# Altium project B2B_Charger.PrjPcb (part 3 of 3)
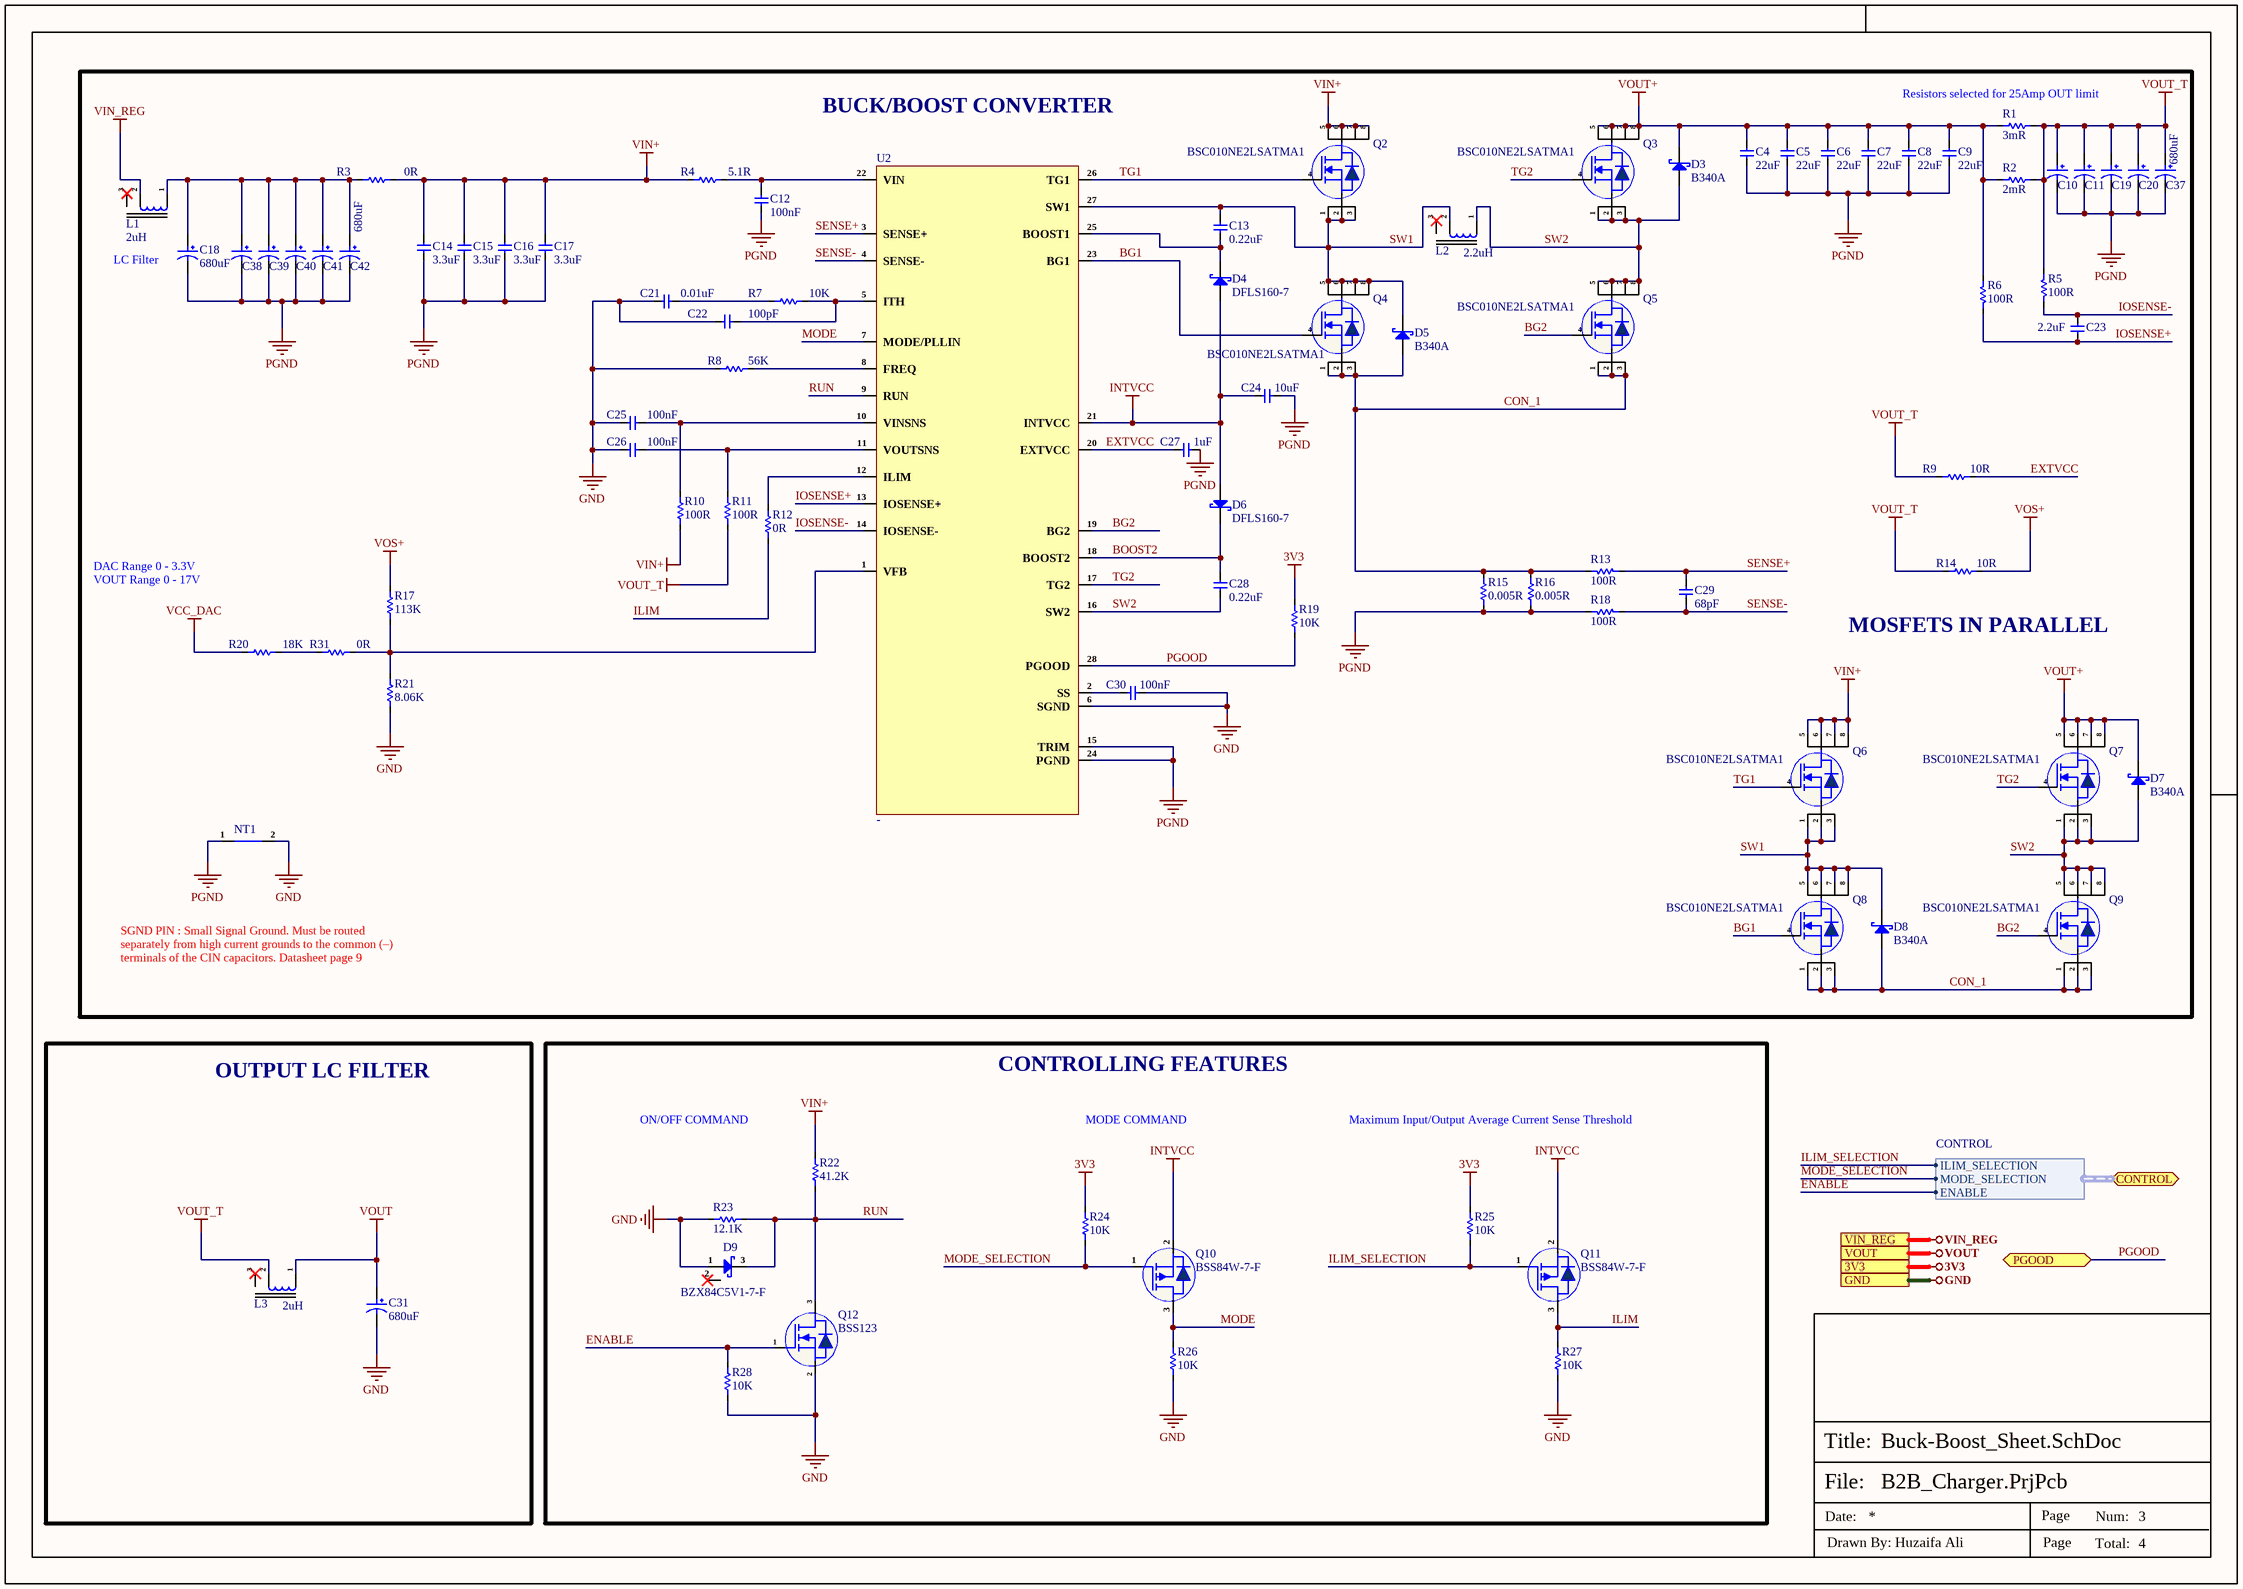
[diagram p5: Buck-Boost_Sheet.SchDoc]

## Sheet Buck-Boost_Sheet.SchDoc (continued)

### Library data of the parts (continued)
R23 = RT0603CRD0712K1L: RES SMD 12.1K OHM 1/10W 0603; Manufacturer: Yageo; Resistance: 12.1kR; Tolerance: 0.25%; Temperature Coefficient: 25ppm/°C; Power Rating: 100mW; Voltage Rating: 75V; Voltage Rating (DC): 50V; Supplier 1: Digi-Key; Manufacturer Part Number: RT0603CRD0712K1L; RoHS: Yes; Category: Chip SMD Resistors; Pricing 1: 5000=0.06299 (USD); Case/Package: 0603; Contact Plating: Tin,Matte; Case Code (Metric): 1608; Case Code (Imperial): 0603; Min Operating Temperature: -55°C; Max Operating Temperature: 125°C; Resistor Type: Thin Film; Package Quantity: 5000; Packaging: Tape and Reel; Number of Terminations: 2; Termination: SMD/SMT; Max Power Dissipation: 100mW; Series: RT; Length: 0.063inch; Width: 0.031inch; Height: 0.022inch; Radiation Hardening: No; Lead Free: Lead Free; RoHS Compliant: Yes; ComponentLink1URL: https://datasheet.ciiva.com/2590/pyu-rt-1-to-0-05-rohs-l-5-2590806.pdf?src-supplier=Digi-Key; ComponentLink1Description: https://datasheet.ciiva.com/2590/pyu-rt-1-to-0-05-rohs-l-5-2590806.pdf?src-supplier=Digi-Key; ComponentLink2URL: https://datasheet.ciiva.com/8891/pyu-rt-1-to-0-05-rohs-l-4-8891049.pdf?src-supplier=Avnet; ComponentLink2Description: https://datasheet.ciiva.com/8891/pyu-rt-1-to-0-05-rohs-l-4-8891049.pdf?src-supplier=Avnet; ComponentLink3URL: https://datasheet.ciiva.com/12721/pyu-rt-1-to-0-05-rohs-l-4-12721018.pdf?src-supplier=Mouser; ComponentLink3Description: https://datasheet.ciiva.com/12721/pyu-rt-1-to-0-05-rohs-l-4-12721018.pdf?src-supplier=Mouser; Supplier Part Number 1: RT0603CRD0712K1L-ND; LCSC Part Number: C705893
R31 = RC0805FR-070RL: RES 0 OHM JUMPER 1/8W 0805; Manufacturer: Yageo; Resistance: 0mR; Tolerance: 1%; Power Rating: 125mW; Item Type: Resistor; Supplier 1: Avnet; Manufacturer Part Number: RC0805FR-070RL; RoHS: Yes; Category: Chip SMD Resistors; Stock 1: 85000; Pricing 1: 5000=0.00281, 10000=0.00277, 20000=0.00269 (USD); Case/Package: 0805; Contact Plating: Tin,Matte; Case Code (Imperial): 0805; Case Code (Metric): 2012; Size Code: 0805; Min Operating Temperature: -55°C; Max Operating Temperature: 155°C; Resistor Type: Thick Film; Packaging: Tape and Reel; Features: Moisture Resistant; Series: RC; Max Power Dissipation: 125mW; Number of Terminations: 2; Construction: Rectangular; Length: 2mm; Depth: 1.25mm; Radiation Hardening: No; Military Standard: Not; Lead Free: Lead Free; RoHS Compliant: Yes; ComponentLink1URL: https://datasheet.ciiva.com/15189/getdatasheetpartid-348154-15189885.pdf?src-supplier=Verical; ComponentLink1Description: https://datasheet.ciiva.com/15189/getdatasheetpartid-348154-15189885.pdf?src-supplier=Verical; ComponentLink2URL: https://datasheet.ciiva.com/17042/rc0805-17042698.pdf?src-supplier=Future+Electronics; ComponentLink2Description: https://datasheet.ciiva.com/17042/rc0805-17042698.pdf?src-supplier=Future+Electronics; Supplier Part Number 1: RC0805FR-070RL; LCSC Part Number: C100045
U2 = LTC3789EGN#TRPBF: IC REG CTRLR BUCK-BOOST 28SSOP; Manufacturer: Analog Devices / Linear Technology; Supplier: Mouser; Supplier Part Number: 584-LTC3789EGN#TRPBF; Manufacturer Part Number: LTC3789EGN#TRPBF; RoHS: Yes; Category: Voltage Regulators - Switching; Stock: 782; Pricing: 1=11.87, 10=10.91, 50=10.46, 100=9.21, 1000=7.52, 10000=7.23 (USD); ComponentLink1URL: https://datasheet.ciiva.com/2019/30095-2019043.pdf?src-supplier=Digikey; ComponentLink1Description: https://datasheet.ciiva.com/2019/30095-2019043.pdf?src-supplier=Digikey; Item Type: IC

## Sheet Reverse_Protection_Sheet.SchDoc
size 420 x 297 mm; SheetNumber: 2; SheetTotal: 4
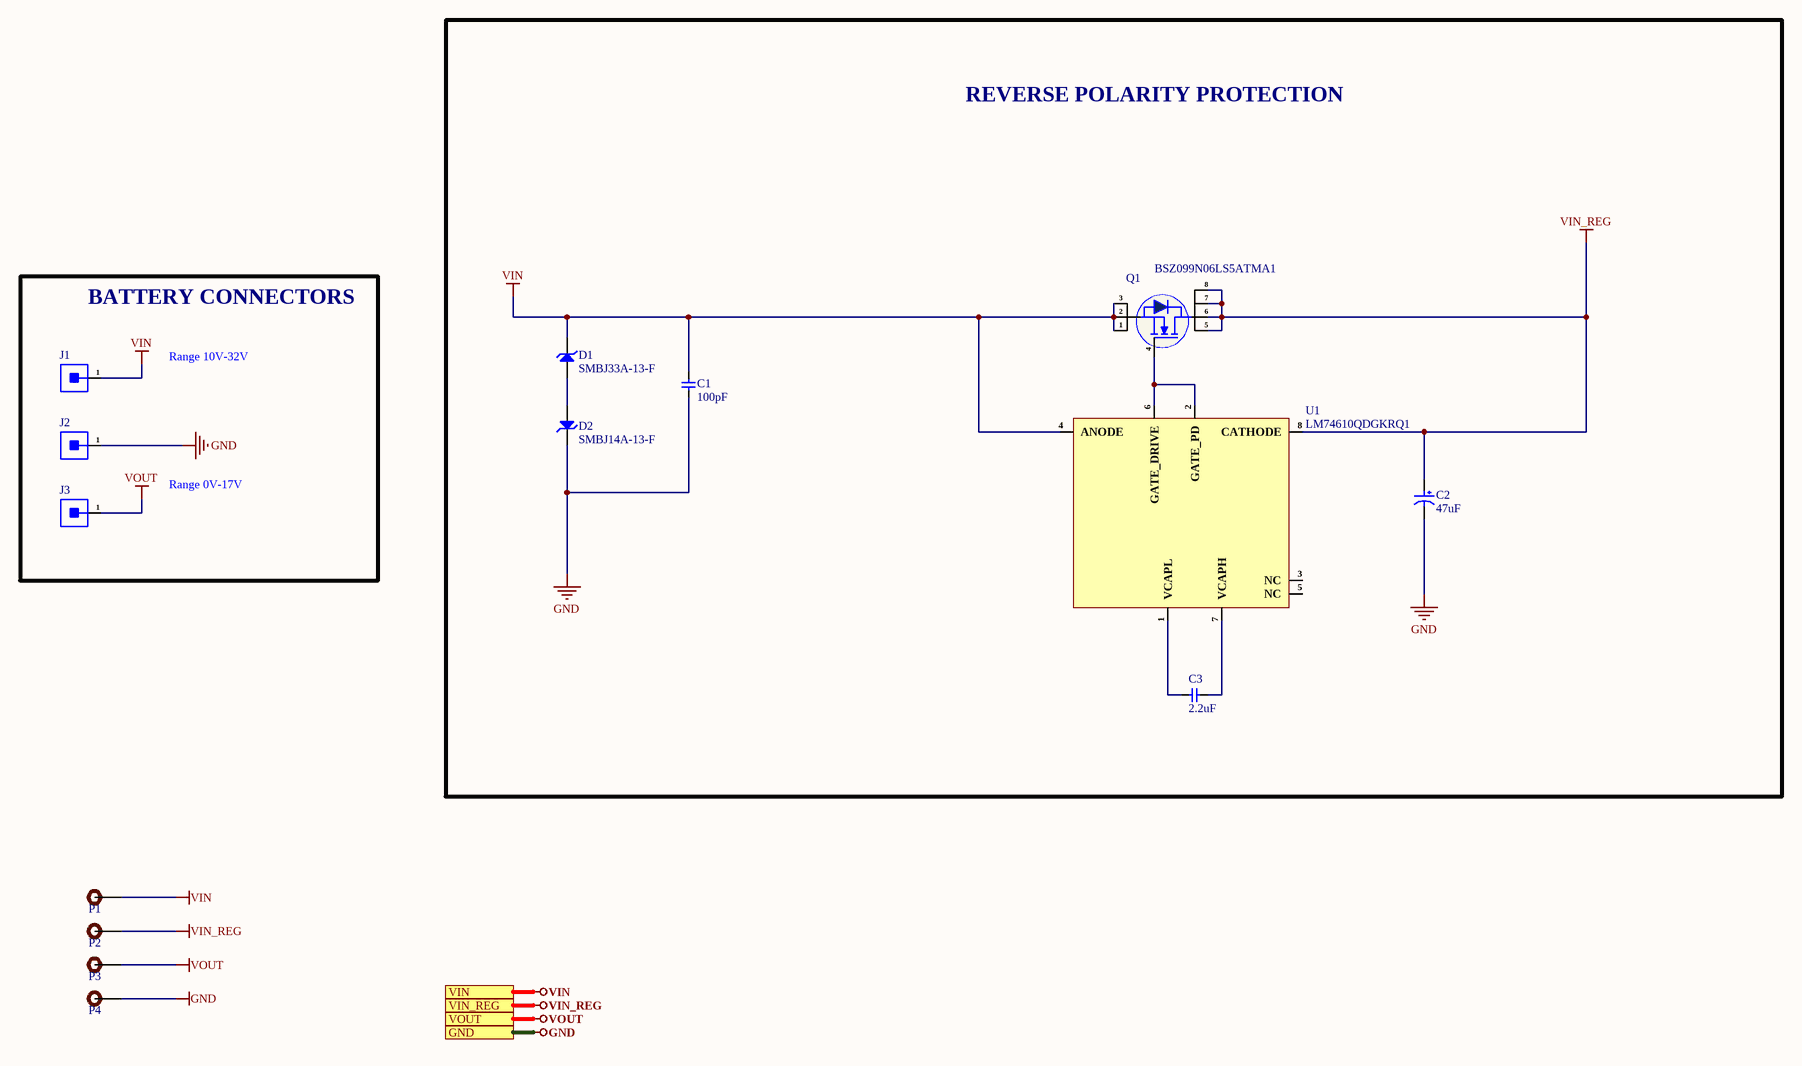
[diagram p3: Reverse_Protection_Sheet.SchDoc]

### Parts
C1  100pF  [Cap-0805]
C2  47uF  [A780EN476M1HLAS050]
C3  2.2uF  [Cap-0805]
D1  SMBJ33A-13-F  [SMB_]
D2  SMBJ14A-13-F  [SMB_]
J1  1P SMD PAD  [1P SMD PAD]  (value not drawn)
J2  1P SMD PAD  [1P SMD PAD]  (value not drawn)
J3  1P SMD PAD  [1P SMD PAD]  (value not drawn)
P1  TEST POINT  [Test-point]  (value not drawn)  (no BOM)
P2  TEST POINT  [Test-point]  (value not drawn)  (no BOM)
P3  TEST POINT  [Test-point]  (value not drawn)  (no BOM)
P4  TEST POINT  [Test-point]  (value not drawn)  (no BOM)
Q1  BSZ099N06LS5ATMA1  [PG-TSDSON-8-FL]
U1  LM74610QDGKRQ1  [8-VSSOP (5x3.1mm)]

### Blocks framed on the sheet
REVERSE POLARITY PROTECTION: C1-C3 D1 D2 Q1 U1
BATTERY CONNECTORS: J1-J3

### Ports
GND, VIN, VIN_REG, VOUT

### Nets
GND: C1.1 C2.2 D2.2(K) J2.1 P4.1 ; port GND
VIN: C1.2 D1.2(K) J1.1 P1.1 Q1.1(S) Q1.2(S) Q1.3(S) U1.4(ANODE) ; port VIN
VIN_REG: C2.1 P2.1 Q1.5(D) Q1.6(D) Q1.7(D) Q1.8(D) U1.8(CATHODE) ; port VIN_REG
VOUT: J3.1 P3.1 ; port VOUT
NetC3_1: C3.1 U1.1(VCAPL)
NetC3_2: C3.2 U1.7(VCAPH)
NetD1_1: D1.1(A) D2.1(A)
NetQ1_4: Q1.4(G) U1.2(GATE_PD) U1.6(GATE_DRIVE)

Not connected (* = marked no-connect by the designer): U1 3(NC) 5(NC)

### Notes on the sheet
- Range 10V-32V
- Range 0V-17V
- File:
- Title:
- Date:
- Page
- Num:
- Total:
- Drawn By: Huzaifa Ali

### Library data of the parts
C1 = CC0805KRX7R9BB101: CAP CER 100PF 50V X7R 0805; Manufacturer: Yageo; Item Type: Capacitor; Supplier: Future Electronics; Supplier Part Number: 3327608; Manufacturer Part Number: CC0805KRX7R9BB101; RoHS: Yes; Category: Ceramic Capacitors; Stock: 516000; Pricing: 4000=0.0077, 16000=0.0073, 60000=0.007, 100000=0.0068, 200000=0.0065 (USD); ComponentLink1URL: https://datasheet.ciiva.com/11465/upy-gphc-x7r-6-3v-to-50v-8-11465306.pdf?src-supplier=Avnet; ComponentLink1Description: https://datasheet.ciiva.com/11465/upy-gphc-x7r-6-3v-to-50v-8-11465306.pdf?src-supplier=Avnet; LCSC Part Number: C107140
C2 = A780EN476M1HLAS050: CAP ALUM HYB 47UF 20% 50V SMD; Manufacturer: KEMET; Item Type: Capacitor; Supplier: Mouser; Supplier Part Number: 80-A780EN476M1HLAS50; Manufacturer Part Number: A780EN476M1HLAS050; RoHS: No; Category: Polymer Capacitors; Stock: 5998; Pricing: 1=0.67, 10=0.397, 50=0.397, 100=0.323, 1000=0.212, 10000=0.188 (USD)
C3 = C2012X5R1H225K125AB: CAP CER 2.2UF 50V X5R 0805; Manufacturer: TDK; Dielectric Material: 4241ConductorMaterial; Item Type: Capacitor; Supplier: Avnet; Supplier Part Number: C2012X5R1H225K125AB; Manufacturer Part Number: C2012X5R1H225K125AB; RoHS: Yes; Category: Ceramic Capacitors; Stock: 6000; Pricing: 2000=0.08532 (USD); Material: 4241ConductorMaterial; Lead Free: 5697LeadFree; ComponentLink1URL: https://datasheet.ciiva.com/24216/c2012x5r1h225k125ab-264892-24216756.pdf?src-supplier=Mouser; ComponentLink1Description: https://datasheet.ciiva.com/24216/c2012x5r1h225k125ab-264892-24216756.pdf?src-supplier=Mouser; ComponentLink2URL: https://datasheet.ciiva.com/6287/tdkmlcccaprange-6287487.pdf?src-supplier=Digikey; ComponentLink2Description: https://datasheet.ciiva.com/6287/tdkmlcccaprange-6287487.pdf?src-supplier=Digikey; ComponentLink3URL: https://datasheet.ciiva.com/6287/tdkmlcccaprange-6287494.pdf?src-supplier=Digikey; ComponentLink3Description: https://datasheet.ciiva.com/6287/tdkmlcccaprange-6287494.pdf?src-supplier=Digikey; ComponentLink4URL: https://datasheet.ciiva.com/6287/tdkmlcccaprange-6287500.pdf?src-supplier=Digikey; ComponentLink4Description: https://datasheet.ciiva.com/6287/tdkmlcccaprange-6287500.pdf?src-supplier=Digikey; ComponentLink5URL: https://datasheet.ciiva.com/28451/1796654-28451710.pdf?src-supplier=Element14; ComponentLink5Description: https://datasheet.ciiva.com/28451/1796654-28451710.pdf?src-supplier=Element14; ComponentLink6URL: https://datasheet.ciiva.com/22725/1913358-22725562.pdf?src-supplier=Element14; ComponentLink6Description: https://datasheet.ciiva.com/22725/1913358-22725562.pdf?src-supplier=Element14
D1 = SMBJ33A-13-F: TVS DIODE 33VWM 53.3VC SMB; Manufacturer: Diodes; Direction: Unidirectional; Reverse Breakdown Voltage: 36.7V; Max Surge Current: 11.3A; Number of Unidirectional Channels: 1; Reverse Standoff Voltage: 33V; Clamping Voltage: 53.3V; Peak Pulse Power: 600W; Power Line Protection: No; Breakdown Voltage: 42.2V; Max Reverse Leakage Current: 5uA; Test Current: 1mA; Diode Type: ZENER; Supplier: Future Electronics; Supplier Part Number: 1049444; Manufacturer Part Number: SMBJ33A-13-F; RoHS: Yes; Category: TVS Diodes; Stock: 87000; Pricing: 3000=0.0879, 9000=0.0845, 12000=0.0836, 30000=0.0809, 45000=0.0782 (USD); Mounting Technology: Surface Mount; Case/Package: SMB; Pins: 2; Min Operating Temperature: -55°C; Max Operating Temperature: 150°C; Packaging: Tape and Reel; Package Quantity: 3000; Min Breakdown Voltage: 36.7V; Polarity: Unidirectional; Termination: SMD/SMT; Number of Elements: 1; Peak Pulse Current: 11.3A; Max Breakdown Voltage: 42.2V; Power Dissipation: 600W; Leakage Current: 5uA; Working Voltage: 33V; Max Power Dissipation: 600W; Voltage Rating (DC): 33V; Series: SMBJ; Clamping Voltage-Max: 53.3V; Length: 4.57mm; Width: 3.9mm; Height: 2.62mm; Radiation Hardening: No; Lead Free: Lead Free; RoHS Compliant: Yes; ComponentLink1URL: https://datasheet.ciiva.com/16211/ds19002-16211005.pdf?src-supplier=Future+Electronics; ComponentLink1Description: https://datasheet.ciiva.com/16211/ds19002-16211005.pdf?src-supplier=Future+Electronics; ComponentLink2URL: https://datasheet.ciiva.com/26912/getdatasheetpartid-202382-26912459.pdf?src-supplier=Verical; ComponentLink2Description: https://datasheet.ciiva.com/26912/getdatasheetpartid-202382-26912459.pdf?src-supplier=Verical; ComponentLink3URL: https://datasheet.ciiva.com/48477/ds19002-48477445.pdf?src-supplier=Avnet; ComponentLink3Description: https://datasheet.ciiva.com/48477/ds19002-48477445.pdf?src-supplier=Avnet; Item Type: Diode
D2 = SMBJ14A-13-F: TVS DIODE 14VWM 23.2VC SMB; Manufacturer: Diodes; Direction: Unidirectional; Reverse Breakdown Voltage: 15.6V; Max Surge Current: 25.8A; Reverse Standoff Voltage: 14V; Clamping Voltage: 23.2V; Max Power Dissipation: 600W; Number of Elements: 1; Test Current: 1mA; Max Reverse Leakage Current: 5uA; Max Breakdown Voltage: 17.9V; Forward Voltage: 5V; Value: 1nF; Number of Channels: 1NUMBER; Supplier: Digikey; Supplier Part Number: SMBJ14A-FDICT-ND; Manufacturer Part Number: SMBJ14A-13-F; RoHS: Yes; Category: TVS Diodes; Stock: 21112; Pricing: 1=0.43, 10=0.305, 100=0.1538, 500=0.13628, 1000=0.10605 (USD); Mounting Technology: Surface Mount; Case/Package: SMB; Pins: 2; Min Operating Temperature: -55°C; Max Operating Temperature: 150°C; Packaging: Tape and Reel; Package Quantity: 1; Polarity: Unidirectional; Termination: SMD/SMT; Working Voltage: 14V; Breakdown Voltage: 15.6V; Peak Pulse Current: 25.8A; Peak Pulse Power: 600W; Min Breakdown Voltage: 15.6V; Power Dissipation: 600W; Leakage Current: 5uA; Voltage Rating (DC): 14V; Max Output current: 25.8A; Series: SMBJ; Clamping Voltage-Max: 23.2V; Length: 4.57mm; Width: 3.9mm; Height: 2.62mm; Radiation Hardening: No; Lead Free: Lead Free; RoHS Compliant: Yes; ComponentLink1URL: https://datasheet.ciiva.com/15143/getdatasheetpartid-91658-15143394.pdf?src-supplier=Verical; ComponentLink1Description: https://datasheet.ciiva.com/15143/getdatasheetpartid-91658-15143394.pdf?src-supplier=Verical; ComponentLink2URL: https://datasheet.ciiva.com/16487/ds19002-16487576.pdf?src-supplier=Future+Electronics; ComponentLink2Description: https://datasheet.ciiva.com/16487/ds19002-16487576.pdf?src-supplier=Future+Electronics; Item Type: Diode
J1-J3 = 1P SMD PAD: Wire Connecting Pad; Item Type: SMD Pad; Manufacturer Part Number: 1P SMD PAD
P1-P4 = TEST POINT: Test Point ON; Item Type: TEST POINT
Q1 = BSZ099N06LS5ATMA1: MOSFET N-CH 60V 46A TSDSON; Manufacturer: Infineon; Item Type: IC; Supplier: Mouser; Supplier Part Number: 726-BSZ099N06LS5ATMA; Manufacturer Part Number: BSZ099N06LS5ATMA1; RoHS: Yes; Category: MOSFETs; Stock: 54204; Pricing: 1=0.92, 10=0.704, 50=0.704, 100=0.572, 1000=0.382, 10000=0.346 (USD); Mounting Technology: Surface Mount; Pins: 8; Min Operating Temperature: -55°C; Max Dual Supply Voltage: 60V; Drain to Source Voltage (Vdss): 60V; Packaging: Tape and Reel; Series: *; RoHS Compliant: Yes; Lead Free: Contains Lead; Halogen Free: Halogen Free; ComponentLink1URL: https://www.infineon.com/dgdl/Infineon-BSZ099N06LS5-DS-v02_02-EN.pdf?fileId=5546d4625696ed760156e5d71c9f4f8e&src-supplier=Digikey; ComponentLink1Description: https://www.infineon.com/dgdl/Infineon-BSZ099N06LS5-DS-v02_02-EN.pdf?fileId=5546d4625696ed760156e5d71c9f4f8e&src-supplier=Digikey
U1 = LM74610QDGKRQ1: IC SMART DIODE CTLR 8VSSOP; Manufacturer: Texas Instruments; Quiescent Current: 0pA; Operating Supply Current: 0A; Supplier: Mouser; Supplier Part Number: 595-LM74610QDGKRQ1; Manufacturer Part Number: LM74610QDGKRQ1; RoHS: Yes; Category: Power Management ICs; Stock: 4920; Pricing: 1=2.47, 10=2.1, 50=2.1, 100=1.79, 1000=1.2, 10000=1.08 (USD); Mounting Technology: Surface Mount; Case/Package: VSSOP; Pins: 8; Weight: 0.005997oz; Min Operating Temperature: -40°C; Max Operating Temperature: 125°C; Packaging: Cut Tape; Series: Automotive, AEC-Q100; Package Quantity: 2500; Lead Free: Lead Free; RoHS Compliant: Yes; ComponentLink1URL: http://www.ti.com/lit/ds/symlink/lm74610-q1.pdf?src-supplier=Digikey; ComponentLink1Description: http://www.ti.com/lit/ds/symlink/lm74610-q1.pdf?src-supplier=Digikey; Item Type: IC

## Nets that join several sheets
3V3: Controller_Sheet (8 pins), Buck-Boost_Sheet (R19.2 R24.2 R25.2)
GND: Controller_Sheet (9 pins), Buck-Boost_Sheet (16 pins), Reverse_Protection_Sheet (5 pins)
VCC_DAC: Controller_Sheet (U3.10), Buck-Boost_Sheet (R20.2)
VIN_REG: Controller_Sheet (C35.2 C36.2 D10.1 U4.1), Buck-Boost_Sheet (L1.2), Reverse_Protection_Sheet (7 pins)
VOUT: Buck-Boost_Sheet (C31.1 L3.1), Reverse_Protection_Sheet (J3.1 P3.1)
ENABLE: Controller_Sheet (U3.19), Buck-Boost_Sheet (Q12.1 R28.2)
ILIM_SELECTION: Controller_Sheet (U3.21), Buck-Boost_Sheet (Q11.1 R25.1)
MODE_SELECTION: Controller_Sheet (U3.18), Buck-Boost_Sheet (Q10.1 R24.1)
PGOOD: Controller_Sheet (U3.20), Buck-Boost_Sheet (R19.1 U2.28)